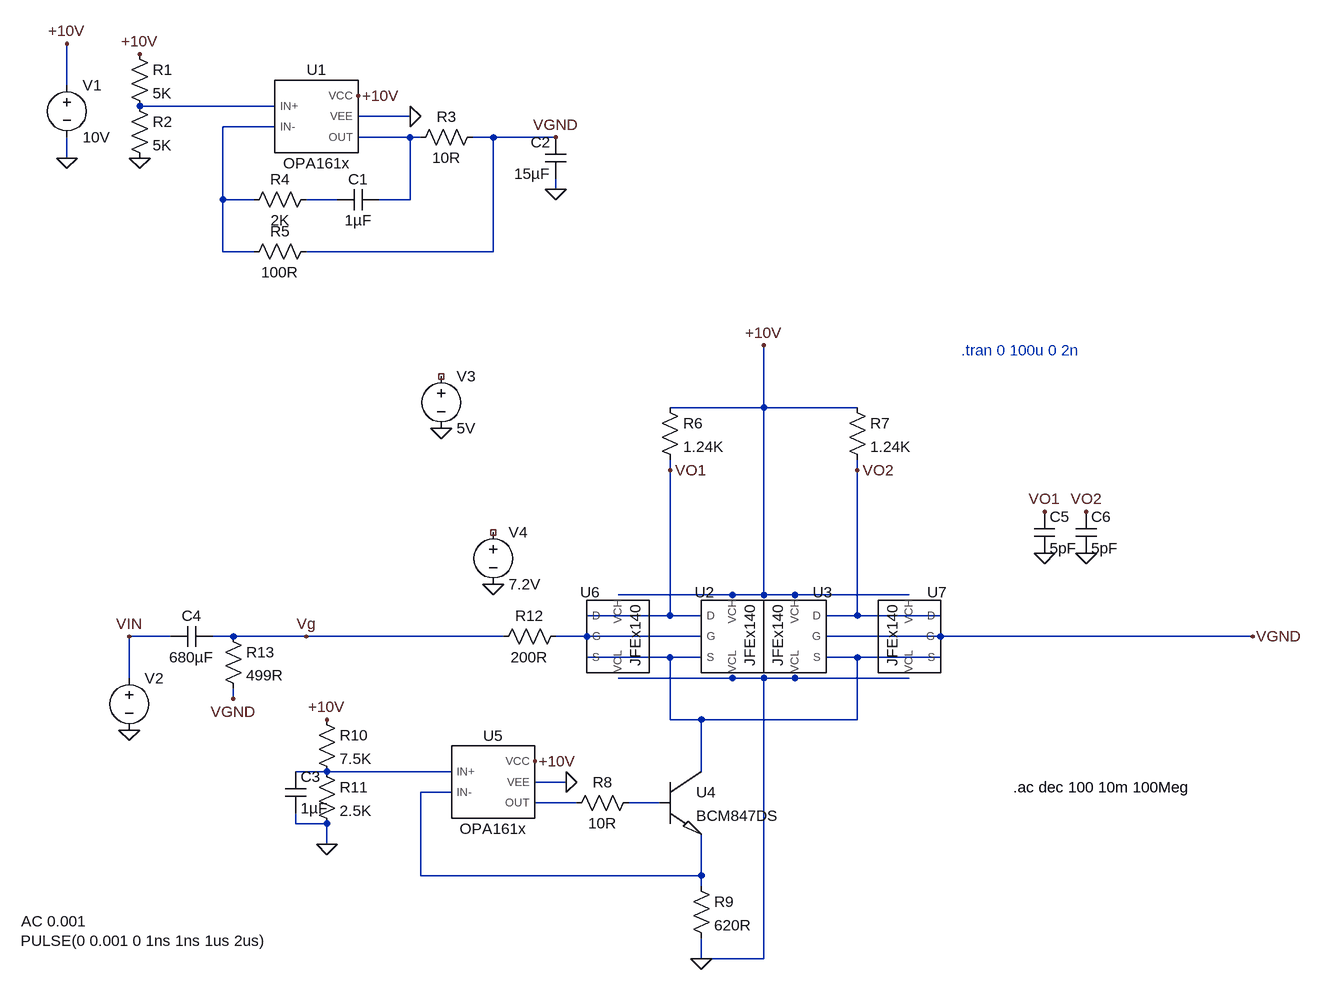
[diagram p0: schematic Vitual_GND_Second_fixed.asc]
Vitual_GND_Second_fixed.asc, the LTspice schematic file:
Version 4.1
SHEET 1 884 948
WIRE -1664 -432 -1664 -496
WIRE -1344 -400 -1552 -400
WIRE -1136 -384 -1216 -384
WIRE -1344 -368 -1424 -368
WIRE -1136 -352 -1216 -352
WIRE -1120 -352 -1136 -352
WIRE -1008 -352 -1040 -352
WIRE -912 -352 -1008 -352
WIRE -1664 -320 -1664 -352
WIRE -912 -272 -912 -288
WIRE -1424 -256 -1424 -368
WIRE -1376 -256 -1424 -256
WIRE -1248 -256 -1296 -256
WIRE -1136 -256 -1136 -352
WIRE -1136 -256 -1184 -256
WIRE -1424 -176 -1424 -256
WIRE -1376 -176 -1424 -176
WIRE -1008 -176 -1008 -352
WIRE -1008 -176 -1296 -176
WIRE -592 64 -592 -32
WIRE -592 64 -736 64
WIRE -448 64 -592 64
WIRE -736 160 -736 144
WIRE -448 160 -448 144
WIRE -640 352 -816 352
WIRE -592 352 -592 64
WIRE -592 352 -640 352
WIRE -544 352 -592 352
WIRE -368 352 -544 352
WIRE -736 384 -736 160
WIRE -736 384 -864 384
WIRE -688 384 -736 384
WIRE -448 384 -448 160
WIRE -448 384 -496 384
WIRE -320 384 -448 384
WIRE -1504 416 -1568 416
WIRE -1408 416 -1440 416
WIRE -1296 416 -1408 416
WIRE -992 416 -1296 416
WIRE -864 416 -912 416
WIRE -688 416 -864 416
WIRE -320 416 -496 416
WIRE 160 416 -320 416
WIRE -736 448 -864 448
WIRE -688 448 -736 448
WIRE -448 448 -496 448
WIRE -320 448 -448 448
WIRE -1568 480 -1568 416
WIRE -640 480 -816 480
WIRE -592 480 -640 480
WIRE -544 480 -592 480
WIRE -368 480 -544 480
WIRE -1408 512 -1408 496
WIRE -736 544 -736 448
WIRE -688 544 -736 544
WIRE -448 544 -448 448
WIRE -448 544 -688 544
WIRE -1264 624 -1312 624
WIRE -1072 624 -1264 624
WIRE -688 624 -688 544
WIRE -896 640 -944 640
WIRE -1072 656 -1120 656
WIRE -880 672 -944 672
WIRE -752 672 -800 672
WIRE -1312 704 -1312 688
WIRE -1264 704 -1312 704
WIRE -1264 736 -1264 704
WIRE -1120 784 -1120 656
WIRE -688 784 -688 720
WIRE -688 784 -1120 784
WIRE -688 800 -688 784
WIRE -688 912 -688 880
WIRE -592 912 -592 480
WIRE -592 912 -688 912
FLAG -1664 -320 0
FLAG -1664 -496 +10V
FLAG -1216 -416 +10V
FLAG -1136 -384 0
FLAG -1552 -480 +10V
FLAG -1552 -320 0
FLAG -912 -272 0
FLAG -592 -32 +10V
FLAG -688 912 0
FLAG -1264 736 0
FLAG -1264 544 +10V
FLAG -944 608 +10V
FLAG -896 640 0
FLAG -736 160 VO1
FLAG -448 160 VO2
FLAG -1568 560 0
FLAG -1408 512 VGND
FLAG -1296 416 Vg
FLAG -1088 96 0
FLAG -912 -352 VGND
FLAG 160 416 VGND
FLAG -1568 416 VIN
FLAG -160 224 VO1
FLAG -160 288 0
FLAG -96 224 VO2
FLAG -96 288 0
FLAG -1008 336 0
SYMBOL OPA161x -1280 -384 R0
SYMATTR InstName U1
SYMBOL voltage -1664 -448 R0
WINDOW 123 0 0 Left 0
WINDOW 39 0 0 Left 0
SYMATTR InstName V1
SYMATTR Value 10V
SYMBOL res -1568 -496 R0
SYMATTR InstName R1
SYMATTR Value 5K
SYMBOL res -1568 -416 R0
SYMATTR InstName R2
SYMATTR Value 5K
SYMBOL res -1024 -368 R90
WINDOW 0 0 56 VBottom 2
WINDOW 3 32 56 VTop 2
SYMATTR InstName R3
SYMATTR Value 10R
SYMBOL res -1280 -272 R90
WINDOW 0 0 56 VBottom 2
WINDOW 3 32 56 VTop 2
SYMATTR InstName R4
SYMATTR Value 2K
SYMBOL res -1280 -192 R90
WINDOW 0 0 56 VBottom 2
WINDOW 3 32 56 VTop 2
SYMATTR InstName R5
SYMATTR Value 100R
SYMBOL cap -1184 -272 R90
WINDOW 0 0 32 VBottom 2
WINDOW 3 32 32 VTop 2
SYMATTR InstName C1
SYMATTR Value 1µF
SYMBOL cap -896 -288 R180
WINDOW 0 24 56 Left 2
WINDOW 3 24 8 Left 2
SYMATTR InstName C2
SYMATTR Value 15µF
SYMBOL JFEx140 -640 416 R0
SYMATTR InstName U2
SYMBOL JFEx140 -544 416 M0
SYMATTR InstName U3
SYMBOL res -752 48 R0
SYMATTR InstName R6
SYMATTR Value 1.24K
SYMBOL res -464 48 R0
SYMATTR InstName R7
SYMATTR Value 1.24K
SYMBOL BCM847DS -752 624 R0
SYMATTR InstName U4
SYMBOL OPA161x -1008 640 R0
SYMATTR InstName U5
SYMBOL res -784 656 R90
WINDOW 0 0 56 VBottom 2
WINDOW 3 32 56 VTop 2
SYMATTR InstName R8
SYMATTR Value 10R
SYMBOL res -704 784 R0
SYMATTR InstName R9
SYMATTR Value 620R
SYMBOL res -1280 528 R0
SYMATTR InstName R10
SYMATTR Value 7.5K
SYMBOL res -1280 608 R0
SYMATTR InstName R11
SYMATTR Value 2.5K
SYMBOL cap -1328 624 R0
SYMATTR InstName C3
SYMATTR Value 1µF
SYMBOL JFEx140 -816 416 R0
SYMATTR InstName U6
SYMBOL JFEx140 -368 416 M0
SYMATTR InstName U7
SYMBOL res -896 400 R90
WINDOW 0 0 56 VBottom 2
WINDOW 3 32 56 VTop 2
SYMATTR InstName R12
SYMATTR Value 200R
SYMBOL voltage -1568 464 R0
WINDOW 3 -167 420 Left 2
WINDOW 123 -166 390 Left 2
WINDOW 39 0 0 Left 0
SYMATTR Value PULSE(0 0.001 0 1ns 1ns 1us 2us)
SYMATTR Value2 AC 0.001
SYMATTR InstName V2
SYMBOL cap -1440 400 R90
WINDOW 0 0 32 VBottom 2
WINDOW 3 32 32 VTop 2
SYMATTR InstName C4
SYMATTR Value 680µF
SYMBOL res -1424 400 R0
SYMATTR InstName R13
SYMATTR Value 499R
SYMBOL voltage -1088 0 R0
WINDOW 123 0 0 Left 0
WINDOW 39 0 0 Left 0
SYMATTR InstName V3
SYMATTR Value 5V
SYMBOL cap -176 224 R0
SYMATTR InstName C5
SYMATTR Value 5pF
SYMBOL cap -112 224 R0
SYMATTR InstName C6
SYMATTR Value 5pF
SYMBOL voltage -1008 240 R0
WINDOW 123 0 0 Left 0
WINDOW 39 0 0 Left 0
SYMATTR InstName V4
SYMATTR Value 7.2V
TEXT -208 648 Left 2 !.ac dec 100 10m 100Meg
TEXT -288 -24 Left 2 ;.tran 0 100u 0 2n

The netlist it stands for:
* Vitual_GND_Second_fixed.asc
X§U1 N001 N002 +10V 0 N003 OPA161x  ; pins IN+ IN- VCC VEE OUT
V1 +10V 0 10V
R1 +10V N001 5K
R2 N001 0 5K
R3 VGND N003 10R
R4 N004 N002 2K
R5 VGND N002 100R
C1 N003 N004 1µF
C2 0 VGND 15µF
X§U2 VO1 N005 N006 +10V 0 JFEx140  ; pins D G S VCH VCL
X§U3 VO2 VGND N006 +10V 0 JFEx140  ; pins D G S VCH VCL
R6 +10V VO1 1.24K
R7 +10V VO2 1.24K
X§U4 N006 N010 N008 BCM847DS  ; pins C B E
X§U5 N007 N008 +10V 0 N009 OPA161x  ; pins IN+ IN- VCC VEE OUT
R8 N010 N009 10R
R9 N008 0 620R
R10 +10V N007 7.5K
R11 N007 0 2.5K
C3 N007 0 1µF
X§U6 VO1 N005 N006 +10V 0 JFEx140  ; pins D G S VCH VCL
X§U7 VO2 VGND N006 +10V 0 JFEx140  ; pins D G S VCH VCL
R12 N005 Vg 200R
V2 VIN 0 PULSE(0 0.001 0 1ns 1ns 1us 2us) AC 0.001
C4 Vg VIN 680µF
R13 Vg VGND 499R
V3 NC_01 0 5V
C5 VO1 0 5pF
C6 VO2 0 5pF
V4 NC_02 0 7.2V
.ac dec 100 10m 100Meg
* .tran 0 100u 0 2n
.lib OPA161x.LIB
.lib jfex140.lib
.lib BCM847.lib
.backanno
.end